# Altium schematic sheet DEVICE1.SchDoc: Explorer STM32F407 Board
size A4; Author: ATOM@ALIENTEK; Revision: V3.4; SheetSize: A4
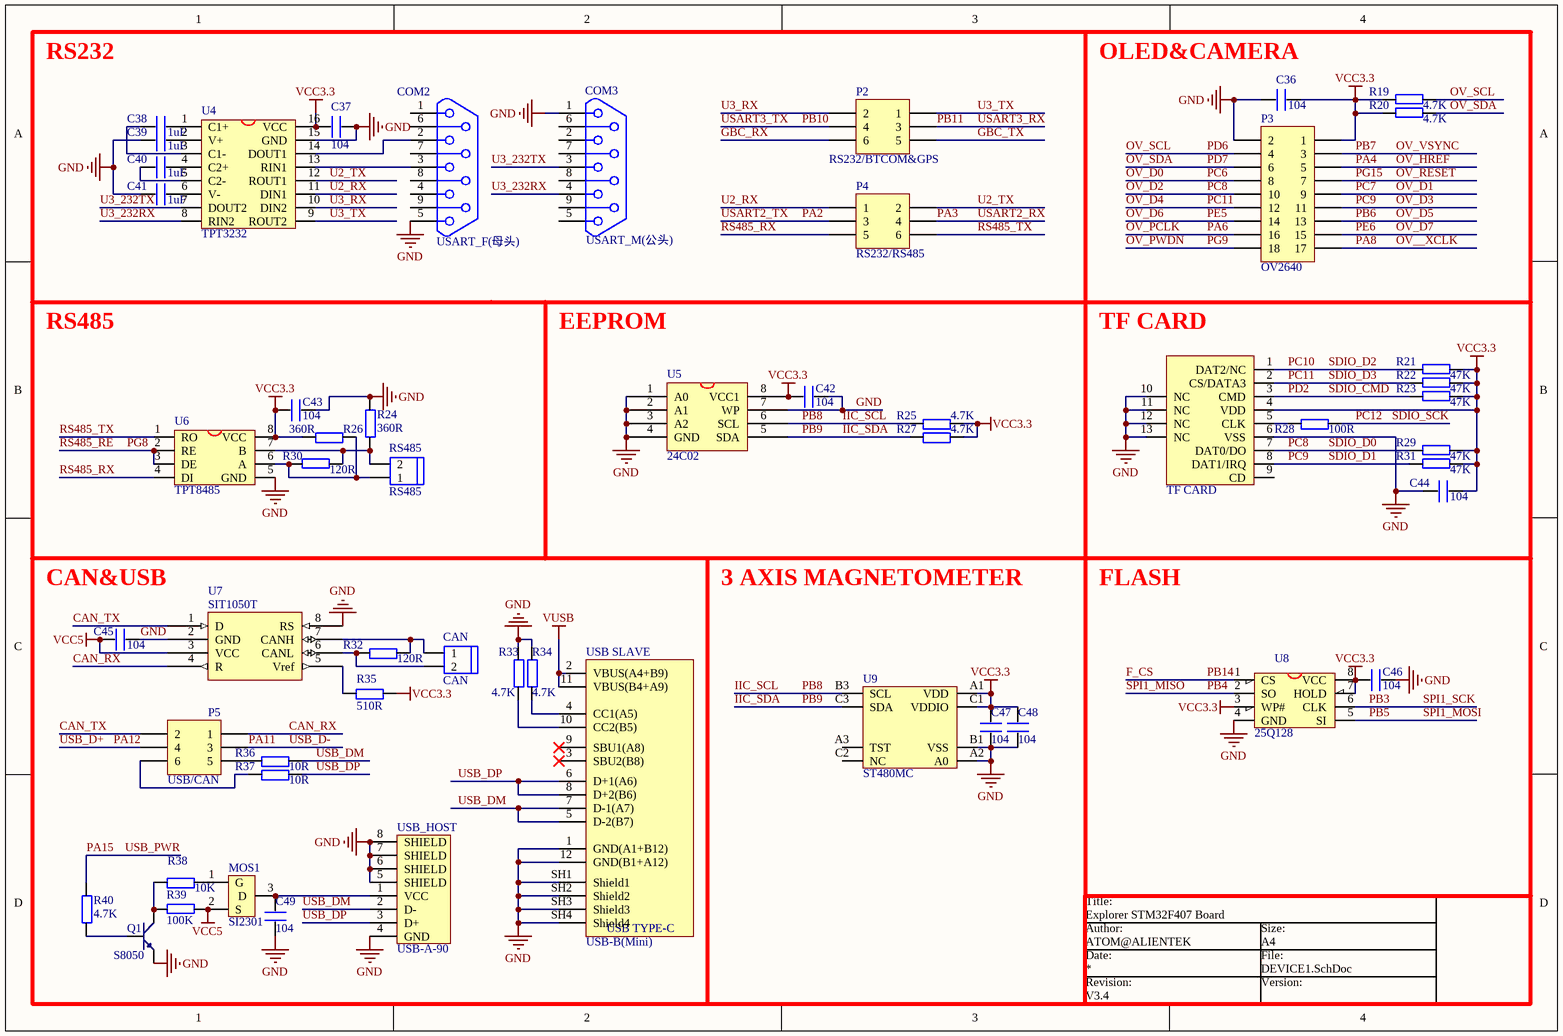
[diagram p0: DEVICE1.SchDoc]

## Parts
C36  104  [0402]
C37  104  [0402]
C38  1uF  [0402]
C39  1uF  [0402]
C40  1uF  [0402]
C41  1uF  [0402]
C42  104  [0402]
C43  104  [0402]
C44  104  [0402]
C45  104  [0402]
C46  104  [0402]
C47  104  [0603P]
C48  104  [0603P]
C49  104  [0402]
CAN  CAN  [HEAD2L-0.8]
COM2  USART_F(母头)  [DB9]
COM3  USART_M(公头)  [DB9]
MOS1  SI2301  [SO-G3/C2.5]
P2  RS232/BTCOM&GPS  [HDR2X3]
P3  OV2640  [HDR2X9]
P4  RS232/RS485  [HDR2X3]
P5  USB/CAN  [HDR2X3]
Q1  S8050  [SOT-23R]
R19  4.7K  [0402]
R20  4.7K  [0402]
R21  47K  [0402]
R22  47K  [0402]
R23  47K  [0402]
R24  360R  [0402]
R25  4.7K  [0402]
R26  360R  [0402]
R27  4.7K  [0402]
R28  100R  [0402]
R29  47K  [0402]
R30  120R  [0402]
R31  47K  [0402]
R32  120R  [0402]
R33  4.7K  [0402]
R34  4.7K  [0402]
R35  510R  [0402]
R36  10R  [0402]
R37  10R  [0402]
R38  10K  [0402]
R39  100K  [0402]
R40  4.7K  [0402]
RS485  RS485  [HEAD2L-0.8]
TF_CARD  SD-MICRO-TF  [SD-MICRO-TF]  (value not drawn)
U4  TPT3232  [SOP16M]
U5  24C02  [SOP-8]
U6  TPT8485  [SOP-8]
U7  SIT1050T  [SOP-8]
U8  25Q128  [SOIC-8]
U9  ST480MC  [ST480MC]
USB_HOST  USB-A-90  [USB-A-90]
USB_SLAVE  USB-B(Mini)  [USB Type-C]

## Nets
GND: C36.2 C37.2 C39.2 C41.1 C42.1 C43.1 C44.1 C45.2 C46.2 C47.1 C48.1 C49.1 COM2.5 COM3.1 P3.2 Q1.1(E) R24.2 R33.2 R34.2 TF_CARD.6(VSS) TF_CARD.10(NC) TF_CARD.11(NC) TF_CARD.12(NC) TF_CARD.13(NC) U4.15(GND) U5.1(A0) U5.2(A1) U5.3(A2) U5.4(GND) U5.7(WP) U6.5(GND) U7.2(GND) U7.8(RS) U8.4(GND) U9.A2(A0) U9.B1(VSS) USB_HOST.4(GND) USB_HOST.5(SHIELD) USB_HOST.6(SHIELD) USB_HOST.7(SHIELD) USB_HOST.8(SHIELD) USB_SLAVE.1(GND(A1+B12)) USB_SLAVE.12(GND(B1+A12)) USB_SLAVE.SH1(Shield1) USB_SLAVE.SH2(Shield2) USB_SLAVE.SH3(Shield3) USB_SLAVE.SH4(Shield4)
VCC3.3: C36.1 C37.1 C42.2 C43.2 C44.2 C46.1 C47.2 C48.2 P3.1 R19.2 R20.2 R21.1 R22.1 R23.1 R25.2 R26.1 R27.2 R29.1 R31.1 R35.2 TF_CARD.4(VDD) U4.16(VCC) U5.8(VCC1) U6.8(VCC) U8.3(WP#) U8.7(HOLD) U8.8(VCC) U9.A1(VDD) U9.C1(VDDIO)
VCC5: C45.1 MOS1.2(S) R39.1 U7.3(VCC)
VUSB: USB_SLAVE.2(VBUS(A4+B9)) USB_SLAVE.11(VBUS(B4+A9))
CAN_RX: P5.1 U7.4(R)
CAN_TX: P5.2 U7.1(D)
F_CS: U8.1(CS)  [also labelled PB14]
GBC_RX: P2.6
GBC_TX: P2.5
IIC_SCL: R25.1 U5.6(SCL) U9.B3(SCL)  [also labelled PB8]
IIC_SDA: R27.1 U5.5(SDA) U9.C3(SDA)  [also labelled PB9]
OV__XCLK: P3.17  [also labelled PA8]
OV_D0: P3.8  [also labelled PC6]
OV_D1: P3.9  [also labelled PC7]
OV_D2: P3.10 R29.2 TF_CARD.7(DAT0/DO)  [also labelled PC8, SDIO_D0]
OV_D3: P3.11 R31.2 TF_CARD.8(DAT1/IRQ)  [also labelled PC9, SDIO_D1]
OV_D4: P3.12 R22.2 TF_CARD.2(CS/DATA3)  [also labelled PC11, SDIO_D3]
OV_D5: P3.13  [also labelled PB6]
OV_D6: P3.14  [also labelled PE5]
OV_D7: P3.15  [also labelled PE6]
OV_HREF: P3.5  [also labelled PA4]
OV_PCLK: P3.16  [also labelled PA6]
OV_PWDN: P3.18  [also labelled PG9]
OV_RESET: P3.7  [also labelled PG15]
OV_SCL: P3.4 R19.1  [also labelled PD6]
OV_SDA: P3.6 R20.1  [also labelled PD7]
OV_VSYNC: P3.3  [also labelled PB7]
PA2: P4.3  [also labelled USART2_TX]
PA3: P4.4  [also labelled USART2_RX]
PA11: P5.3  [also labelled USB_D-]
PA12: P5.4  [also labelled USB_D+]
PA15: R40.2  [also labelled USB_PWR]
PB3: U8.6(CLK)  [also labelled SPI1_SCK]
PB4: U8.2(SO)  [also labelled SPI1_MISO]
PB5: U8.5(SI)  [also labelled SPI1_MOSI]
PB10: P2.4  [also labelled USART3_TX]
PB11: P2.3  [also labelled USART3_RX]
PC10: R21.2 TF_CARD.1(DAT2/NC)  [also labelled SDIO_D2]
PC12: R28.2  [also labelled SDIO_SCK]
PD2: R23.2 TF_CARD.3(CMD)  [also labelled SDIO_CMD]
PG8: U6.2(RE) U6.3(DE)  [also labelled RS485_RE]
RS485_RX: P4.5 U6.4(DI)
RS485_TX: P4.6 U6.1(RO)
U2_RX: P4.1 U4.11(DIN1)
U2_TX: P4.2 U4.12(ROUT1)
U3_232RX: COM3.4 U4.8(RIN2)
U3_232TX: COM3.3 U4.7(DOUT2)
U3_RX: P2.2 U4.10(DIN2)
U3_TX: P2.1 U4.9(ROUT2)
USB_DM: R36.2 USB_HOST.2(D-) USB_SLAVE.5(D-2(B7)) USB_SLAVE.7(D-1(A7))
USB_DP: R37.2 USB_HOST.3(D+) USB_SLAVE.6(D+1(A6)) USB_SLAVE.8(D+2(B6))
NetC38_1: C38.1 U4.1(C1+)
NetC38_2: C38.2 U4.3(C1-)
NetC39_1: C39.1 U4.2(V+)
NetC40_1: C40.1 U4.5(C2-)
NetC40_2: C40.2 U4.4(C2+)
NetC41_2: C41.2 U4.6(V-)
NetC49_2: C49.2 MOS1.3(D) USB_HOST.1(VCC)
NetCAN_1: CAN.1 R32.2 U7.7(CANH)
NetCAN_2: CAN.2 R32.1 U7.6(CANL)
NetCOM2_2: COM2.2 U4.14(DOUT1)
NetCOM2_3: COM2.3 U4.13(RIN1)
NetMOS1_1: MOS1.1(G) R38.2
NetP5_5: P5.5 R36.1
NetP5_6: P5.6 R37.1
NetQ1_2: Q1.2(B) R40.1
NetQ1_3: Q1.3(C) R38.1 R39.2
NetR24_1: R24.1 R30.1 RS485.2 U6.7(B)
NetR26_2: R26.2 R30.2 RS485.1 U6.6(A)
NetR28_1: R28.1 TF_CARD.5(CLK)
NetR33_1: R33.1 USB_SLAVE.10(CC2(B5))
NetR34_1: R34.1 USB_SLAVE.4(CC1(A5))
NetR35_1: R35.1 U7.5(Vref)

Not connected (* = marked no-connect by the designer): COM2 1 4 6 7 8 9; COM3 2 5 6 7 8 9; TF_CARD 9(CD); U9 A3(TST) C2(NC); USB_SLAVE 3(SBU2(B8))* 9(SBU1(A8))*

## Notes on the sheet
- RS232
- OLED&CAMERA
- RS485
- EEPROM
- (near TF_CARD) TF CARD
- (near C45) CAN&USB
- 3 AXIS MAGNETOMETER
- FLASH
- Title:
- Author:
- Date:
- Revision:
- Size:
- File:
- Version:
- (in symbol USB Type-C) USB TYPE-C

## Library data of the parts
C36-C49 = C
CAN RS485 = HEAD2
COM2 COM3 = DB9
MOS1 = MOS-P: IRLML6401/SI2301
P2 P4 P5 = Header 3X2: Header, 3-Pin, Dual row; LatestRevisionDate: 17-Jul-2002; LatestRevisionNote: Re-released for DXP Platform.; Publisher: Altium Limited
P3 = Header 9X2: Header, 9-Pin, Dual row; LatestRevisionDate: 17-Jul-2002; LatestRevisionNote: Re-released for DXP Platform.; Publisher: Altium Limited
Q1 = NPN: 8050/BCW846/BCW847
R19-R40 = R
TF_CARD = SD-MICRO-TF: SD,MICRO,TF
U4 = MAX3232
U5 = 24C256
U6 = MAX3485
U7 = SN65HVD230D
U8 = W25X16: W25X16;SST25VF016;MX25L1605
U9 = ST480MC: 三轴磁力计
USB_HOST = USB_A_90
USB_SLAVE = USB Type-C: 12P TypeC 母座